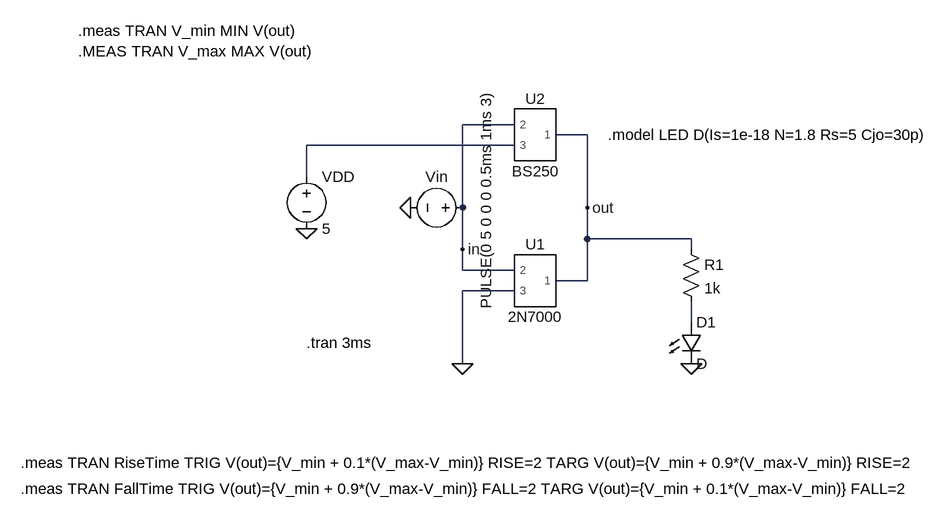
[diagram p0: schematic circuit VDD =5V.asc]
circuit VDD =5V.asc, the LTspice schematic file:
Version 4.1
SHEET 1 1216 680
WIRE -240 16 -320 16
WIRE -128 32 -176 32
WIRE -240 48 -560 48
WIRE -560 96 -560 48
WIRE -320 144 -320 16
WIRE -128 144 -128 32
WIRE -128 192 -128 144
WIRE 32 192 -128 192
WIRE -320 208 -320 144
WIRE 32 208 32 192
WIRE -320 240 -320 208
WIRE -240 240 -320 240
WIRE -128 256 -128 192
WIRE -128 256 -176 256
WIRE -240 272 -320 272
WIRE 32 320 32 288
WIRE -320 384 -320 272
FLAG -320 384 0
FLAG -400 144 0
FLAG -560 176 0
FLAG -128 144 out
FLAG 32 384 0
FLAG -320 208 in
SYMBOL 2N7000 -208 256 M0
SYMATTR InstName U1
SYMBOL BS250 -208 32 M0
SYMATTR InstName U2
SYMBOL voltage -304 144 R90
WINDOW 0 -32 56 VBottom 2
WINDOW 3 -11 -5 Bottom 2
WINDOW 123 0 0 Left 0
WINDOW 39 0 0 Left 0
SYMATTR InstName Vin
SYMATTR Value PULSE(0 5 0 0 0 0.5ms 1ms 3)
SYMBOL voltage -560 80 R0
WINDOW 123 0 0 Left 0
WINDOW 39 0 0 Left 0
SYMATTR InstName VDD
SYMATTR Value 5
SYMBOL res 16 192 R0
SYMATTR InstName R1
SYMATTR Value 1k
SYMBOL LED 16 320 R0
SYMATTR InstName D1
TEXT -96 32 Left 2 !.model LED D(Is=1e-18 N=1.8 Rs=5 Cjo=30p)
TEXT -560 352 Left 2 !.tran 3ms
TEXT -1000 536 Left 2 !.meas TRAN RiseTime TRIG V(out)={V_min + 0.1*(V_max-V_min)} RISE=2 TARG V(out)={V_min + 0.9*(V_max-V_min)} RISE=2
TEXT -912 -128 Left 2 !.meas TRAN V_min MIN V(out)\n.MEAS TRAN V_max MAX V(out)
TEXT -1000 576 Left 2 !.meas TRAN FallTime TRIG V(out)={V_min + 0.9*(V_max-V_min)} FALL=2 TARG V(out)={V_min + 0.1*(V_max-V_min)} FALL=2

The netlist it stands for:
* circuit VDD =5V.asc
X§U1 out in 0 2N7000  ; pins 1 2 3
X§U2 out in N001 BS250  ; pins 1 2 3
Vin in 0 PULSE(0 5 0 0 0 0.5ms 1ms 3)
VDD N001 0 5
R1 out N002 1k
D1 N002 0 D
.model D D
.lib standard.dio
.model LED D(Is=1e-18 N=1.8 Rs=5 Cjo=30p)
.tran 3ms
.meas TRAN RiseTime TRIG V(out)={V_min + 0.1*(V_max-V_min)} RISE=2 TARG V(out)={V_min + 0.9*(V_max-V_min)} RISE=2
.meas TRAN V_min MIN V(out)
.MEAS TRAN V_max MAX V(out)
.meas TRAN FallTime TRIG V(out)={V_min + 0.9*(V_max-V_min)} FALL=2 TARG V(out)={V_min + 0.1*(V_max-V_min)} FALL=2
.lib 2N7000.onsemi.lib
.lib BS250.philips.lib
.backanno
.end